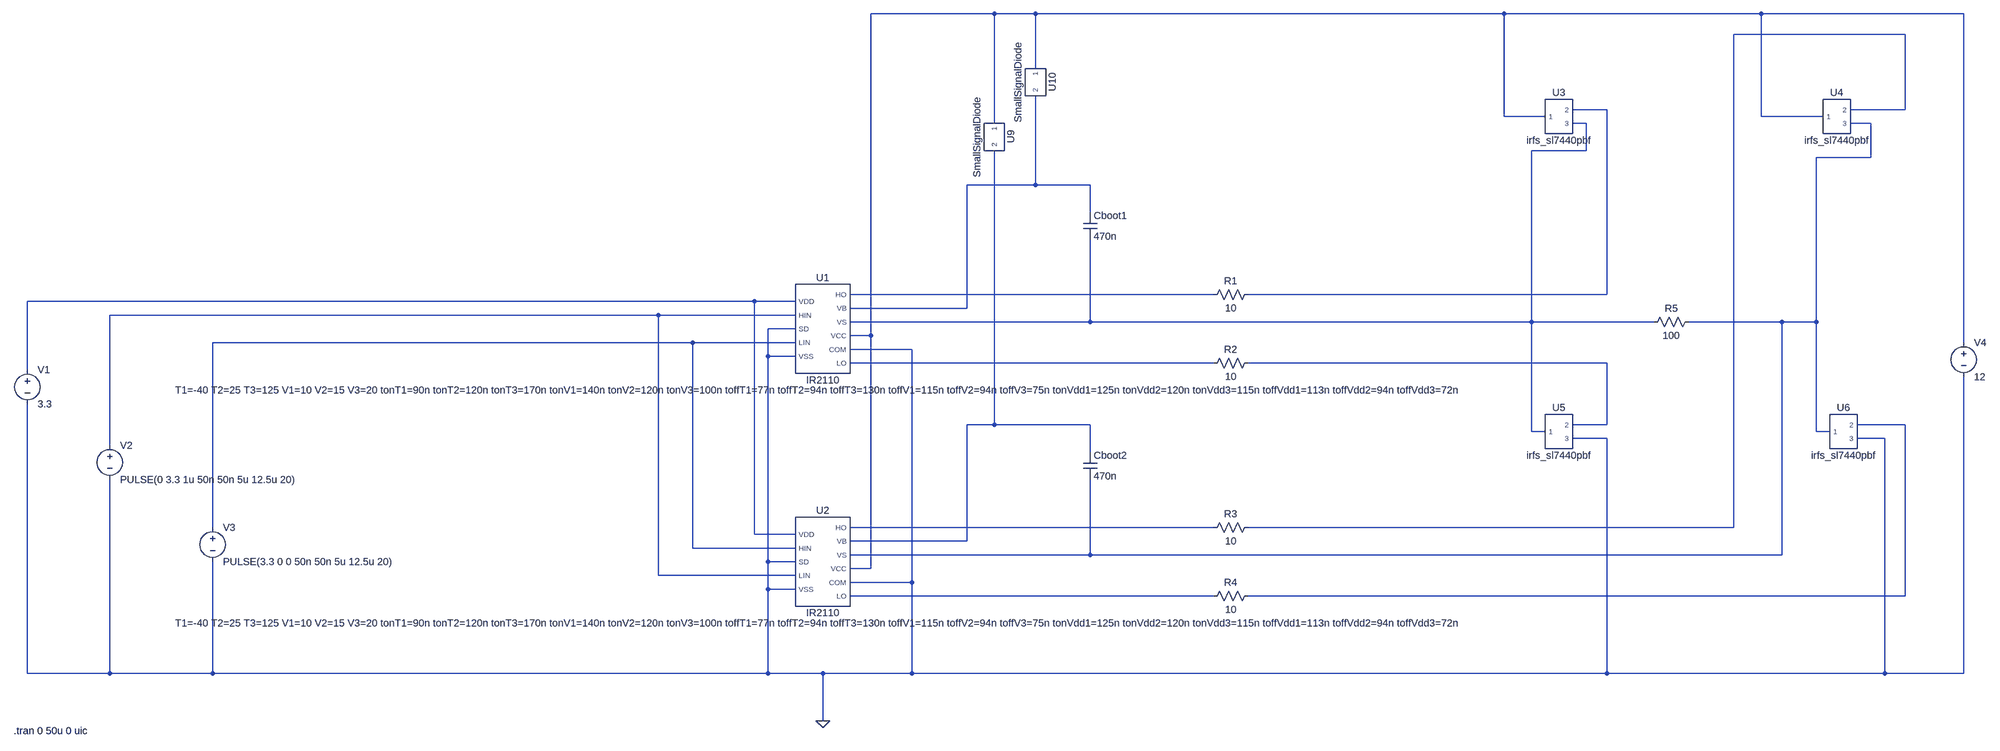
[diagram p0: schematic inverter4.asc]
inverter4.asc, the LTspice schematic file:
Version 4.1
SHEET 1 4632 1588
WIRE 544 -688 256 -688
WIRE 640 -688 544 -688
WIRE 1920 -688 640 -688
WIRE 3232 -688 1920 -688
WIRE 4576 -688 3232 -688
WIRE 3568 -640 3168 -640
WIRE 640 -560 640 -688
WIRE 2160 -464 2080 -464
WIRE 3568 -464 3568 -640
WIRE 3568 -464 3440 -464
WIRE 1920 -448 1920 -688
WIRE 2016 -448 1920 -448
WIRE 3232 -448 3232 -688
WIRE 3376 -448 3232 -448
WIRE 544 -432 544 -688
WIRE 2112 -432 2080 -432
WIRE 3488 -432 3440 -432
WIRE 2112 -368 2112 -432
WIRE 2112 -368 1984 -368
WIRE 3488 -352 3488 -432
WIRE 3488 -352 3360 -352
WIRE 640 -288 640 -496
WIRE 640 -288 480 -288
WIRE 768 -288 640 -288
WIRE 768 -224 768 -288
WIRE 1056 -32 208 -32
WIRE 2160 -32 2160 -464
WIRE 2160 -32 1136 -32
WIRE -16 -16 -1712 -16
WIRE 80 -16 -16 -16
WIRE 480 0 480 -288
WIRE 480 0 208 0
WIRE -240 16 -1520 16
WIRE 80 16 -240 16
WIRE 768 32 768 -160
WIRE 768 32 208 32
WIRE 1984 32 1984 -368
WIRE 1984 32 768 32
WIRE 2592 32 1984 32
WIRE 3280 32 2672 32
WIRE 3360 32 3360 -352
WIRE 3360 32 3280 32
WIRE 80 48 16 48
WIRE 256 64 256 -688
WIRE 256 64 208 64
WIRE -160 80 -1280 80
WIRE 80 80 -160 80
WIRE 4576 80 4576 -688
WIRE 352 96 208 96
WIRE 16 112 16 48
WIRE 80 112 16 112
WIRE 1056 128 208 128
WIRE 2160 128 1136 128
WIRE -1712 144 -1712 -16
WIRE 544 272 544 -368
WIRE 544 272 480 272
WIRE 768 272 544 272
WIRE 2160 272 2160 128
WIRE 2160 272 2080 272
WIRE 3568 272 3456 272
WIRE 1984 288 1984 32
WIRE 2016 288 1984 288
WIRE 3360 288 3360 32
WIRE 3392 288 3360 288
WIRE 2160 304 2080 304
WIRE 3520 304 3456 304
WIRE -1520 320 -1520 16
WIRE 768 336 768 272
WIRE -1280 512 -1280 80
WIRE 1056 512 208 512
WIRE 3168 512 3168 -640
WIRE 3168 512 1136 512
WIRE -16 528 -16 -16
WIRE 80 528 -16 528
WIRE 480 544 480 272
WIRE 480 544 208 544
WIRE -160 560 -160 80
WIRE 80 560 -160 560
WIRE 768 576 768 400
WIRE 768 576 208 576
WIRE 3280 576 3280 32
WIRE 3280 576 768 576
WIRE 16 592 16 112
WIRE 80 592 16 592
WIRE 256 608 256 64
WIRE 256 608 208 608
WIRE -240 624 -240 16
WIRE 80 624 -240 624
WIRE 352 640 352 96
WIRE 352 640 208 640
WIRE 16 656 16 592
WIRE 80 656 16 656
WIRE 1056 672 208 672
WIRE 3568 672 3568 272
WIRE 3568 672 1136 672
WIRE -1712 1008 -1712 224
WIRE -1520 1008 -1520 400
WIRE -1520 1008 -1712 1008
WIRE -1280 1008 -1280 592
WIRE -1280 1008 -1520 1008
WIRE 16 1008 16 656
WIRE 16 1008 -1280 1008
WIRE 144 1008 16 1008
WIRE 352 1008 352 640
WIRE 352 1008 144 1008
WIRE 2160 1008 2160 304
WIRE 2160 1008 352 1008
WIRE 3520 1008 3520 304
WIRE 3520 1008 2160 1008
WIRE 4576 1008 4576 160
WIRE 4576 1008 3520 1008
WIRE 144 1120 144 1008
FLAG 144 1120 0
SYMBOL IR2110 144 48 R0
SYMATTR InstName U1
SYMBOL IR2110 144 592 R0
SYMATTR InstName U2
SYMBOL voltage -1712 128 R0
SYMATTR InstName V1
SYMATTR Value 3.3
SYMBOL voltage -1520 304 R0
WINDOW 123 0 0 Left 0
WINDOW 39 0 0 Left 0
SYMATTR InstName V2
SYMATTR Value PULSE(0 3.3 1u 50n 50n 5u 12.5u 20)
SYMBOL voltage -1280 496 R0
WINDOW 123 0 0 Left 0
WINDOW 39 0 0 Left 0
SYMATTR InstName V3
SYMATTR Value PULSE(3.3 0 0 50n 50n 5u 12.5u 20)
SYMBOL irfs_sl7440pbf 2048 -448 R0
SYMATTR InstName U3
SYMBOL irfs_sl7440pbf 3408 -448 R0
SYMATTR InstName U4
SYMBOL irfs_sl7440pbf 2048 288 R0
SYMATTR InstName U5
SYMBOL irfs_sl7440pbf 3424 288 R0
SYMATTR InstName U6
SYMBOL voltage 4576 64 R0
SYMATTR InstName V4
SYMATTR Value 12
SYMBOL cap 752 -224 R0
SYMATTR InstName Cboot1
SYMATTR Value 470n
SYMBOL cap 752 336 R0
SYMATTR InstName Cboot2
SYMATTR Value 470n
SYMBOL res 1152 -48 R90
WINDOW 0 0 56 VBottom 2
WINDOW 3 32 56 VTop 2
SYMATTR InstName R1
SYMATTR Value 10
SYMBOL res 1152 112 R90
WINDOW 0 0 56 VBottom 2
WINDOW 3 32 56 VTop 2
SYMATTR InstName R2
SYMATTR Value 10
SYMBOL res 1152 496 R90
WINDOW 0 0 56 VBottom 2
WINDOW 3 32 56 VTop 2
SYMATTR InstName R3
SYMATTR Value 10
SYMBOL res 1152 656 R90
WINDOW 0 0 56 VBottom 2
WINDOW 3 32 56 VTop 2
SYMATTR InstName R4
SYMATTR Value 10
SYMBOL SmallSignalDiode 544 -400 R90
SYMATTR InstName U9
SYMBOL SmallSignalDiode 640 -528 R90
SYMATTR InstName U10
SYMBOL res 2688 16 R90
WINDOW 0 0 56 VBottom 2
WINDOW 3 32 56 VTop 2
SYMATTR InstName R5
SYMATTR Value 100
TEXT -1744 1144 Left 2 !.tran 0 50u 0 uic

The netlist it stands for:
* inverter4.asc
X§U1 N008 N009 0 N010 0 N007 N006 N004 N001 0 N011 IR2110 T1=-40 T2=25 T3=125 V1=10 V2=15 V3=20 tonT1=90n tonT2=120n tonT3=170n tonV1=140n tonV2=120n tonV3=100n toffT1=77n toffT2=94n toffT3=130n toffV1=115n toffV2=94n toffV3=75n tonVdd1=125n tonVdd2=120n tonVdd3=115n toffVdd1=113n toffVdd2=94n toffVdd3=72n  ; pins VDD HIN SD LIN VSS HO VB VS VCC COM LO
X§U2 N008 N010 0 N009 0 N015 N013 N005 N001 0 N016 IR2110 T1=-40 T2=25 T3=125 V1=10 V2=15 V3=20 tonT1=90n tonT2=120n tonT3=170n tonV1=140n tonV2=120n tonV3=100n toffT1=77n toffT2=94n toffT3=130n toffV1=115n toffV2=94n toffV3=75n tonVdd1=125n tonVdd2=120n tonVdd3=115n toffVdd1=113n toffVdd2=94n toffVdd3=72n  ; pins VDD HIN SD LIN VSS HO VB VS VCC COM LO
V1 N008 0 3.3
V2 N009 0 PULSE(0 3.3 1u 50n 50n 5u 12.5u 20)
V3 N010 0 PULSE(3.3 0 0 50n 50n 5u 12.5u 20)
X§U3 N001 N003 N004 irfs_sl7440pbf  ; pins 1 2 3
X§U4 N001 N002 N005 irfs_sl7440pbf  ; pins 1 2 3
X§U5 N004 N012 0 irfs_sl7440pbf  ; pins 1 2 3
X§U6 N005 N014 0 irfs_sl7440pbf  ; pins 1 2 3
V4 N001 0 12
Cboot1 N006 N004 470n
Cboot2 N013 N005 470n
R1 N003 N007 10
R2 N012 N011 10
R3 N002 N015 10
R4 N014 N016 10
X§U9 N001 N013 SmallSignalDiode  ; pins 1 2
X§U10 N001 N006 SmallSignalDiode  ; pins 1 2
R5 N005 N004 100
.tran 0 50u 0 uic
.lib IR2110.spi
.lib irfs_sl7440pbf.spi
.lib SmallSignalDiode.spi
.backanno
.end